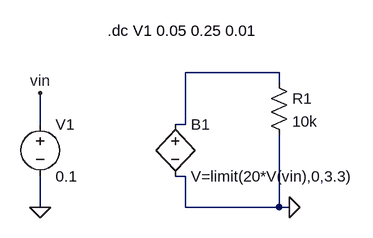
[diagram p0: schematic sensor_front_end_limited.asc]
sensor_front_end_limited.asc, the LTspice schematic file:
Version 4.1
SHEET 1 880 680
WIRE 384 48 240 48
WIRE 384 64 384 48
WIRE 16 128 16 80
WIRE 240 128 240 48
WIRE 240 128 224 128
WIRE 240 208 224 208
WIRE 16 256 16 208
WIRE 240 256 240 208
WIRE 384 256 384 144
WIRE 384 256 240 256
WIRE 400 256 384 256
FLAG 400 256 0
FLAG 16 256 0
FLAG 16 80 vin
SYMBOL voltage 16 112 R0
WINDOW 123 0 0 Left 0
WINDOW 39 0 0 Left 0
SYMATTR InstName V1
SYMATTR Value 0.1
SYMBOL res 368 48 R0
SYMATTR InstName R1
SYMATTR Value 10k
SYMBOL bv 224 112 R0
SYMATTR InstName B1
SYMATTR Value V=limit(20*V(vin),0,3.3)
TEXT 120 -16 Left 2 !.dc V1 0.05 0.25 0.01

The netlist it stands for:
* sensor_front_end_limited.asc
V1 vin 0 0.1
R1 N001 0 10k
B1 N001 0 V=limit(20*V(vin),0,3.3)
.dc V1 0.05 0.25 0.01
.backanno
.end